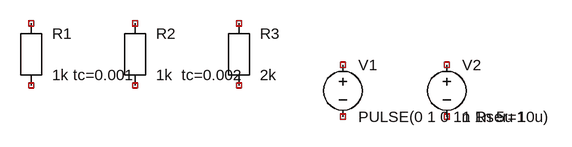
[diagram p0: schematic value_spaces.asc]
value_spaces.asc, the LTspice schematic file:
Version 4
SHEET 1 880 680
SYMBOL res 96 160 R0
SYMATTR InstName R1
SYMATTR Value 1k tc=0.001
SYMBOL res 256 160 R0
SYMATTR InstName R2
SYMATTR Value 1k  tc=0.002
SYMBOL res 416 160 R0
SYMATTR InstName R3
SYMATTR Value  2k
SYMBOL voltage 576 160 R0
SYMATTR InstName V1
SYMATTR Value PULSE(0 1 0 1n 1n 5u 10u)
SYMBOL voltage 736 160 R0
SYMATTR InstName V2
SYMATTR Value 1 Rser=1

The netlist it stands for:
* value_spaces.asc
R1 NC_01 NC_02 1k tc=0.001
R2 NC_03 NC_04 1k  tc=0.002
R3 NC_05 NC_06 2k
V1 NC_07 NC_08 PULSE(0 1 0 1n 1n 5u 10u)
V2 NC_09 NC_10 1 Rser=1
.backanno
.end